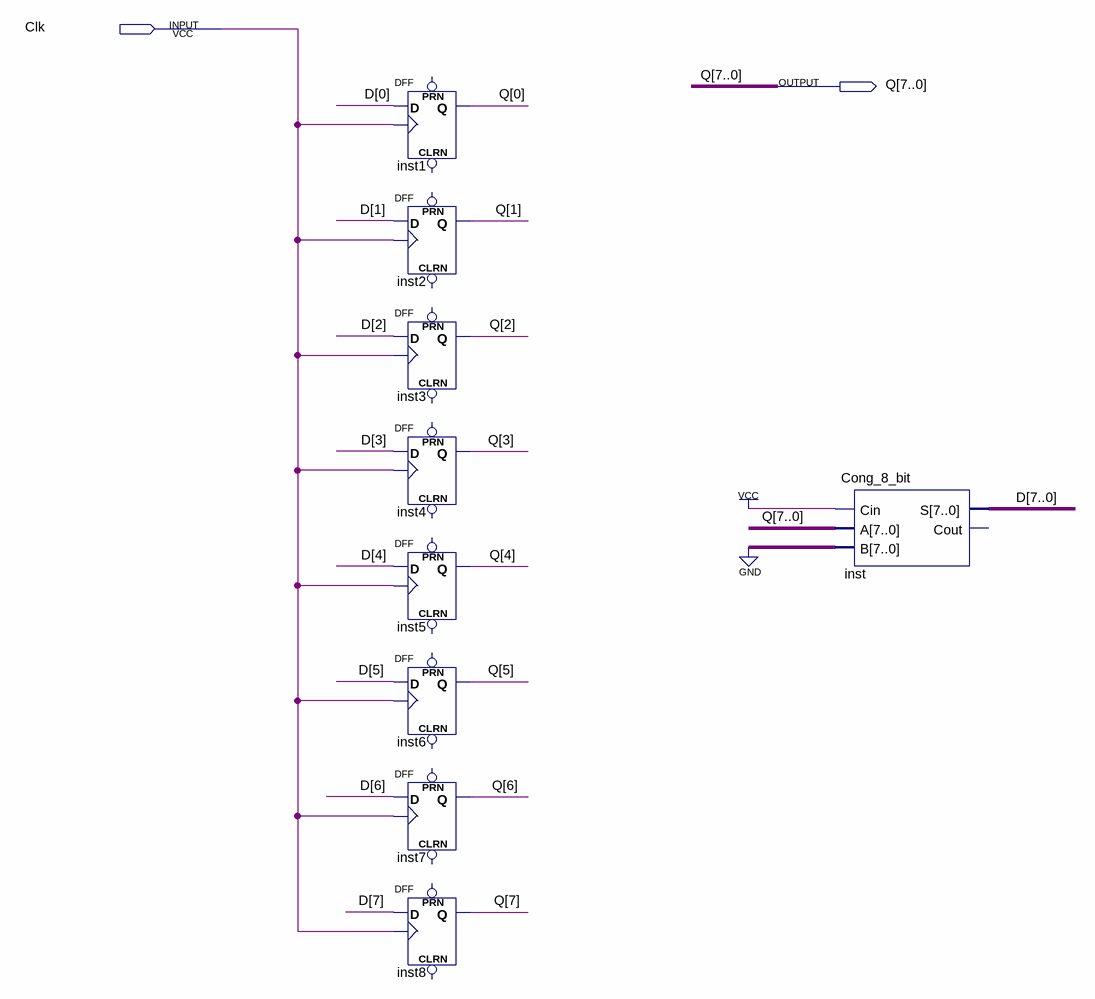
[diagram p0: schematic sheet]
// Quartus schematic COUNTER_0-255.bdf as structural Verilog: 9 symbols, 2 pins
module \COUNTER_0-255  (
  input  Clk,
  output [7:0] Q
);

  wire [7:0] D;

  DFF inst1 (.CLK(Clk), .D(D[0]), .Q(Q[0]));  // open: CLRN, PRN
  DFF inst2 (.CLK(Clk), .D(D[1]), .Q(Q[1]));  // open: CLRN, PRN
  DFF inst3 (.CLK(Clk), .D(D[2]), .Q(Q[2]));  // open: CLRN, PRN
  DFF inst4 (.CLK(Clk), .D(D[3]), .Q(Q[3]));  // open: CLRN, PRN
  DFF inst5 (.CLK(Clk), .D(D[4]), .Q(Q[4]));  // open: CLRN, PRN
  DFF inst6 (.CLK(Clk), .D(D[5]), .Q(Q[5]));  // open: CLRN, PRN
  DFF inst7 (.CLK(Clk), .D(D[6]), .Q(Q[6]));  // open: CLRN, PRN
  DFF inst8 (.CLK(Clk), .D(D[7]), .Q(Q[7]));  // open: CLRN, PRN
  Cong_8_bit inst (.Cin(1'b1), .A(Q), .B({8{1'b0}}), .S(D));  // open: Cout
endmodule
